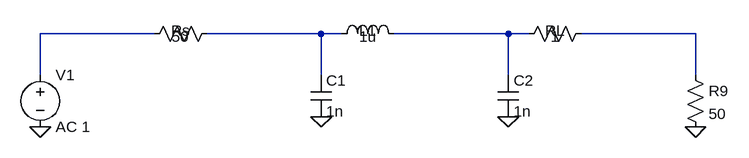
[diagram p0: schematic unseen_pi_filter.asc]
unseen_pi_filter.asc, the LTspice schematic file:
Version 4.1
SHEET 1 1600 1200
WIRE 112 0 -64 0
WIRE -64 0 -64 64
WIRE 944 64 944 0
WIRE 944 0 768 0
WIRE 400 0 368 0
WIRE 368 0 192 0
WIRE 368 64 368 0
WIRE 688 0 656 0
WIRE 656 0 480 0
WIRE 656 64 656 0
FLAG -64 144 0
FLAG 368 128 0
FLAG 656 128 0
FLAG 944 144 0
SYMBOL ind 384 16 R270
WINDOW 0 36 56 VBottom 2
WINDOW 3 -4 56 VTop 2
SYMATTR InstName L1
SYMATTR Value 1u
SYMBOL res 672 16 R270
WINDOW 0 36 56 VBottom 2
WINDOW 3 -4 56 VTop 2
SYMATTR InstName RL
SYMATTR Value 1
SYMBOL res 96 16 R270
WINDOW 0 36 56 VBottom 2
WINDOW 3 -4 56 VTop 2
SYMATTR InstName Rs
SYMATTR Value 50
SYMBOL cap 352 64 R0
SYMATTR InstName C1
SYMATTR Value 1n
SYMBOL cap 640 64 R0
SYMATTR InstName C2
SYMATTR Value 1n
SYMBOL res 928 48 R0
SYMATTR InstName R9
SYMATTR Value 50
SYMBOL voltage -64 48 R0
SYMATTR InstName V1
SYMATTR Value AC 1

The netlist it stands for:
* unseen_pi_filter.asc
L1 N003 N004 1u
RL N004 N002 1
Rs N001 N003 50
C1 N003 0 1n
C2 N004 0 1n
R9 N002 0 50
V1 N001 0 AC 1
.backanno
.end